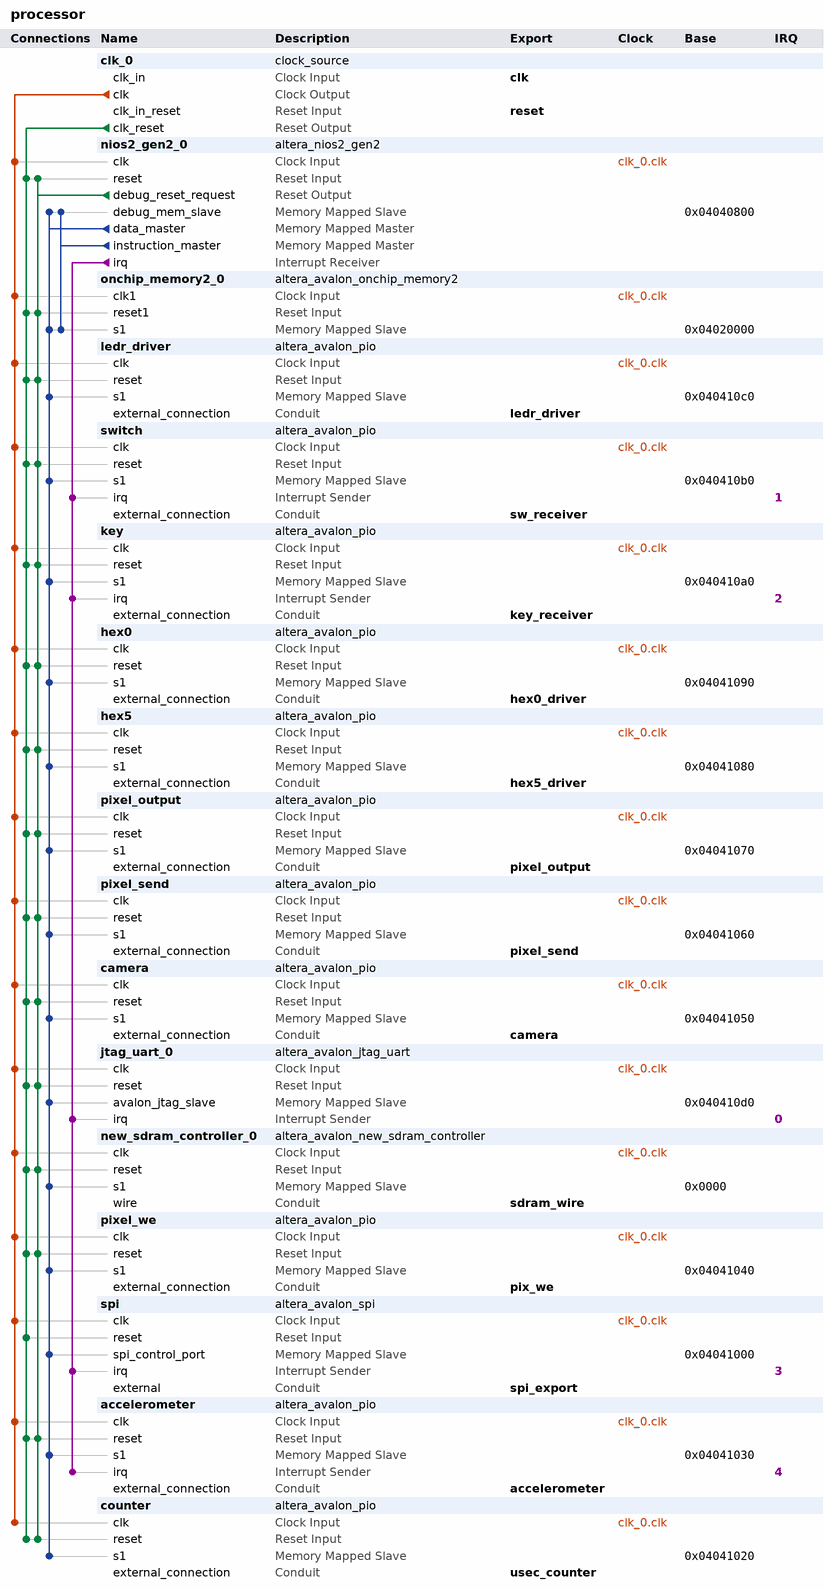
[diagram p0: system contents]
# Platform Designer (Qsys) system processor, MAX 10 10M50DAF484C7G
# Parameters at their usual value, and those the tool derives, are not listed.
package require -exact qsys 18.1
create_system processor
set_project_property DEVICE_FAMILY {MAX 10}
set_project_property DEVICE 10M50DAF484C7G

add_instance clk_0 clock_source 18.1
set_instance_parameter_value clk_0 clockFrequency 50000000

add_instance nios2_gen2_0 altera_nios2_gen2 18.1
set_instance_parameter_value nios2_gen2_0 dcache_size 2048
set_instance_parameter_value nios2_gen2_0 exceptionSlave onchip_memory2_0.s1
set_instance_parameter_value nios2_gen2_0 icache_size 4096
set_instance_parameter_value nios2_gen2_0 impl Fast
set_instance_parameter_value nios2_gen2_0 resetSlave onchip_memory2_0.s1

add_instance onchip_memory2_0 altera_avalon_onchip_memory2 18.1
set_instance_parameter_value onchip_memory2_0 dataWidth 32
set_instance_parameter_value onchip_memory2_0 dualPort false
set_instance_parameter_value onchip_memory2_0 initMemContent true
set_instance_parameter_value onchip_memory2_0 initializationFileName onchip_mem.hex
set_instance_parameter_value onchip_memory2_0 memorySize 102400

add_instance ledr_driver altera_avalon_pio 18.1
set_instance_parameter_value ledr_driver direction Output
set_instance_parameter_value ledr_driver width 10

add_instance switch altera_avalon_pio 18.1
set_instance_parameter_value switch direction Input
set_instance_parameter_value switch generateIRQ true
set_instance_parameter_value switch width 10

add_instance key altera_avalon_pio 18.1
set_instance_parameter_value key direction Input
set_instance_parameter_value key generateIRQ true
set_instance_parameter_value key width 2

add_instance hex0 altera_avalon_pio 18.1
set_instance_parameter_value hex0 direction Output
set_instance_parameter_value hex0 width 24

add_instance hex5 altera_avalon_pio 18.1
set_instance_parameter_value hex5 direction Output
set_instance_parameter_value hex5 width 24

add_instance pixel_output altera_avalon_pio 18.1
set_instance_parameter_value pixel_output direction Output
set_instance_parameter_value pixel_output width 4

add_instance pixel_send altera_avalon_pio 18.1
set_instance_parameter_value pixel_send direction Output
set_instance_parameter_value pixel_send width 17

add_instance camera altera_avalon_pio 18.1
set_instance_parameter_value camera direction Input
set_instance_parameter_value camera width 1

add_instance jtag_uart_0 altera_avalon_jtag_uart 18.1
set_instance_parameter_value jtag_uart_0 simInteractiveOptions NO_INTERACTIVE_WINDOWS

add_instance new_sdram_controller_0 altera_avalon_new_sdram_controller 18.1
set_instance_parameter_value new_sdram_controller_0 TAC 5.5
set_instance_parameter_value new_sdram_controller_0 TRCD 20.0
set_instance_parameter_value new_sdram_controller_0 TRP 20.0
set_instance_parameter_value new_sdram_controller_0 casLatency 3
set_instance_parameter_value new_sdram_controller_0 columnWidth 10
set_instance_parameter_value new_sdram_controller_0 dataWidth 16
set_instance_parameter_value new_sdram_controller_0 generateSimulationModel false
set_instance_parameter_value new_sdram_controller_0 model single_Micron_MT48LC4M32B2_7_chip
set_instance_parameter_value new_sdram_controller_0 numberOfBanks 4
set_instance_parameter_value new_sdram_controller_0 numberOfChipSelects 1
set_instance_parameter_value new_sdram_controller_0 powerUpDelay 100.0
set_instance_parameter_value new_sdram_controller_0 refreshPeriod 15.625
set_instance_parameter_value new_sdram_controller_0 rowWidth 13

add_instance pixel_we altera_avalon_pio 18.1
set_instance_parameter_value pixel_we direction Output
set_instance_parameter_value pixel_we width 1

add_instance spi altera_avalon_spi 18.1
set_instance_parameter_value spi clockPhase 1
set_instance_parameter_value spi clockPolarity 1
set_instance_parameter_value spi dataWidth 8
set_instance_parameter_value spi masterSPI true
set_instance_parameter_value spi numberOfSlaves 2
set_instance_parameter_value spi targetClockRate 5000000

add_instance accelerometer altera_avalon_pio 18.1
set_instance_parameter_value accelerometer captureEdge true
set_instance_parameter_value accelerometer direction Input
set_instance_parameter_value accelerometer generateIRQ true
set_instance_parameter_value accelerometer irqType EDGE
set_instance_parameter_value accelerometer width 1

add_instance counter altera_avalon_pio 18.1
set_instance_parameter_value counter direction Input
set_instance_parameter_value counter width 32

# connections
add_connection clk_0.clk accelerometer.clk clock
add_connection clk_0.clk camera.clk clock
add_connection clk_0.clk counter.clk clock
add_connection clk_0.clk hex0.clk clock
add_connection clk_0.clk hex5.clk clock
add_connection clk_0.clk jtag_uart_0.clk clock
add_connection clk_0.clk key.clk clock
add_connection clk_0.clk ledr_driver.clk clock
add_connection clk_0.clk new_sdram_controller_0.clk clock
add_connection clk_0.clk nios2_gen2_0.clk clock
add_connection clk_0.clk onchip_memory2_0.clk1 clock
add_connection clk_0.clk pixel_output.clk clock
add_connection clk_0.clk pixel_send.clk clock
add_connection clk_0.clk pixel_we.clk clock
add_connection clk_0.clk spi.clk clock
add_connection clk_0.clk switch.clk clock
add_connection clk_0.clk_reset accelerometer.reset reset
add_connection clk_0.clk_reset camera.reset reset
add_connection clk_0.clk_reset counter.reset reset
add_connection clk_0.clk_reset hex0.reset reset
add_connection clk_0.clk_reset hex5.reset reset
add_connection clk_0.clk_reset jtag_uart_0.reset reset
add_connection clk_0.clk_reset key.reset reset
add_connection clk_0.clk_reset ledr_driver.reset reset
add_connection clk_0.clk_reset new_sdram_controller_0.reset reset
add_connection clk_0.clk_reset nios2_gen2_0.reset reset
add_connection clk_0.clk_reset onchip_memory2_0.reset1 reset
add_connection clk_0.clk_reset pixel_output.reset reset
add_connection clk_0.clk_reset pixel_send.reset reset
add_connection clk_0.clk_reset pixel_we.reset reset
add_connection clk_0.clk_reset spi.reset reset
add_connection clk_0.clk_reset switch.reset reset
add_connection nios2_gen2_0.debug_reset_request accelerometer.reset reset
add_connection nios2_gen2_0.debug_reset_request camera.reset reset
add_connection nios2_gen2_0.debug_reset_request counter.reset reset
add_connection nios2_gen2_0.debug_reset_request hex0.reset reset
add_connection nios2_gen2_0.debug_reset_request hex5.reset reset
add_connection nios2_gen2_0.debug_reset_request jtag_uart_0.reset reset
add_connection nios2_gen2_0.debug_reset_request key.reset reset
add_connection nios2_gen2_0.debug_reset_request ledr_driver.reset reset
add_connection nios2_gen2_0.debug_reset_request new_sdram_controller_0.reset reset
add_connection nios2_gen2_0.debug_reset_request nios2_gen2_0.reset reset
add_connection nios2_gen2_0.debug_reset_request onchip_memory2_0.reset1 reset
add_connection nios2_gen2_0.debug_reset_request pixel_output.reset reset
add_connection nios2_gen2_0.debug_reset_request pixel_send.reset reset
add_connection nios2_gen2_0.debug_reset_request pixel_we.reset reset
add_connection nios2_gen2_0.debug_reset_request switch.reset reset
add_connection nios2_gen2_0.data_master accelerometer.s1 avalon
set_connection_parameter_value nios2_gen2_0.data_master/accelerometer.s1 baseAddress 0x04041030
add_connection nios2_gen2_0.data_master camera.s1 avalon
set_connection_parameter_value nios2_gen2_0.data_master/camera.s1 baseAddress 0x04041050
add_connection nios2_gen2_0.data_master counter.s1 avalon
set_connection_parameter_value nios2_gen2_0.data_master/counter.s1 baseAddress 0x04041020
add_connection nios2_gen2_0.data_master hex0.s1 avalon
set_connection_parameter_value nios2_gen2_0.data_master/hex0.s1 baseAddress 0x04041090
add_connection nios2_gen2_0.data_master hex5.s1 avalon
set_connection_parameter_value nios2_gen2_0.data_master/hex5.s1 baseAddress 0x04041080
add_connection nios2_gen2_0.data_master jtag_uart_0.avalon_jtag_slave avalon
set_connection_parameter_value nios2_gen2_0.data_master/jtag_uart_0.avalon_jtag_slave baseAddress 0x040410d0
add_connection nios2_gen2_0.data_master key.s1 avalon
set_connection_parameter_value nios2_gen2_0.data_master/key.s1 baseAddress 0x040410a0
add_connection nios2_gen2_0.data_master ledr_driver.s1 avalon
set_connection_parameter_value nios2_gen2_0.data_master/ledr_driver.s1 baseAddress 0x040410c0
add_connection nios2_gen2_0.data_master new_sdram_controller_0.s1 avalon
set_connection_parameter_value nios2_gen2_0.data_master/new_sdram_controller_0.s1 baseAddress 0x0000
add_connection nios2_gen2_0.data_master nios2_gen2_0.debug_mem_slave avalon
set_connection_parameter_value nios2_gen2_0.data_master/nios2_gen2_0.debug_mem_slave baseAddress 0x04040800
add_connection nios2_gen2_0.data_master onchip_memory2_0.s1 avalon
set_connection_parameter_value nios2_gen2_0.data_master/onchip_memory2_0.s1 baseAddress 0x04020000
add_connection nios2_gen2_0.data_master pixel_output.s1 avalon
set_connection_parameter_value nios2_gen2_0.data_master/pixel_output.s1 baseAddress 0x04041070
add_connection nios2_gen2_0.data_master pixel_send.s1 avalon
set_connection_parameter_value nios2_gen2_0.data_master/pixel_send.s1 baseAddress 0x04041060
add_connection nios2_gen2_0.data_master pixel_we.s1 avalon
set_connection_parameter_value nios2_gen2_0.data_master/pixel_we.s1 baseAddress 0x04041040
add_connection nios2_gen2_0.data_master spi.spi_control_port avalon
set_connection_parameter_value nios2_gen2_0.data_master/spi.spi_control_port baseAddress 0x04041000
add_connection nios2_gen2_0.data_master switch.s1 avalon
set_connection_parameter_value nios2_gen2_0.data_master/switch.s1 baseAddress 0x040410b0
add_connection nios2_gen2_0.instruction_master nios2_gen2_0.debug_mem_slave avalon
set_connection_parameter_value nios2_gen2_0.instruction_master/nios2_gen2_0.debug_mem_slave baseAddress 0x04040800
add_connection nios2_gen2_0.instruction_master onchip_memory2_0.s1 avalon
set_connection_parameter_value nios2_gen2_0.instruction_master/onchip_memory2_0.s1 baseAddress 0x04020000
add_connection nios2_gen2_0.irq accelerometer.irq interrupt
set_connection_parameter_value nios2_gen2_0.irq/accelerometer.irq irqNumber 4
add_connection nios2_gen2_0.irq jtag_uart_0.irq interrupt
set_connection_parameter_value nios2_gen2_0.irq/jtag_uart_0.irq irqNumber 0
add_connection nios2_gen2_0.irq key.irq interrupt
set_connection_parameter_value nios2_gen2_0.irq/key.irq irqNumber 2
add_connection nios2_gen2_0.irq spi.irq interrupt
set_connection_parameter_value nios2_gen2_0.irq/spi.irq irqNumber 3
add_connection nios2_gen2_0.irq switch.irq interrupt
set_connection_parameter_value nios2_gen2_0.irq/switch.irq irqNumber 1

# exported interfaces
add_interface accelerometer conduit end
set_interface_property accelerometer EXPORT_OF accelerometer.external_connection
add_interface camera conduit end
set_interface_property camera EXPORT_OF camera.external_connection
add_interface clk clock sink
set_interface_property clk EXPORT_OF clk_0.clk_in
add_interface hex0_driver conduit end
set_interface_property hex0_driver EXPORT_OF hex0.external_connection
add_interface hex5_driver conduit end
set_interface_property hex5_driver EXPORT_OF hex5.external_connection
add_interface key_receiver conduit end
set_interface_property key_receiver EXPORT_OF key.external_connection
add_interface ledr_driver conduit end
set_interface_property ledr_driver EXPORT_OF ledr_driver.external_connection
add_interface pix_we conduit end
set_interface_property pix_we EXPORT_OF pixel_we.external_connection
add_interface pixel_output conduit end
set_interface_property pixel_output EXPORT_OF pixel_output.external_connection
add_interface pixel_send conduit end
set_interface_property pixel_send EXPORT_OF pixel_send.external_connection
add_interface reset reset sink
set_interface_property reset EXPORT_OF clk_0.clk_in_reset
add_interface sdram_wire conduit end
set_interface_property sdram_wire EXPORT_OF new_sdram_controller_0.wire
add_interface spi_export conduit end
set_interface_property spi_export EXPORT_OF spi.external
add_interface sw_receiver conduit end
set_interface_property sw_receiver EXPORT_OF switch.external_connection
add_interface usec_counter conduit end
set_interface_property usec_counter EXPORT_OF counter.external_connection

set_interconnect_requirement {$system} qsys_mm.clockCrossingAdapter HANDSHAKE
set_interconnect_requirement {$system} qsys_mm.enableEccProtection FALSE
set_interconnect_requirement {$system} qsys_mm.insertDefaultSlave FALSE
set_interconnect_requirement {$system} qsys_mm.maxAdditionalLatency 1

save_system processor.qsys
